# Altium schematic sheet BMC096C.schdoc (part 1 of 3)
size 432 x 279 mm; Device: C:\NSCUtils\Altium\Templates\AD18\TI_ANSI-B.SchDot; Symbol: C:\NSCUtils\Altium\Templates\AD18\TI_ANSI-B.SchDot; Width: 1700; Height: 1100; X Region Count: 6; Y Region Count: 4; Blade Width: 20; Region Start: 1; Border: 1; Title Block Position: 3; Name: C:\NSCUtils\Altium\Templates\AD18\TI_ANSI-B.SchDot; Add into BOM: yes
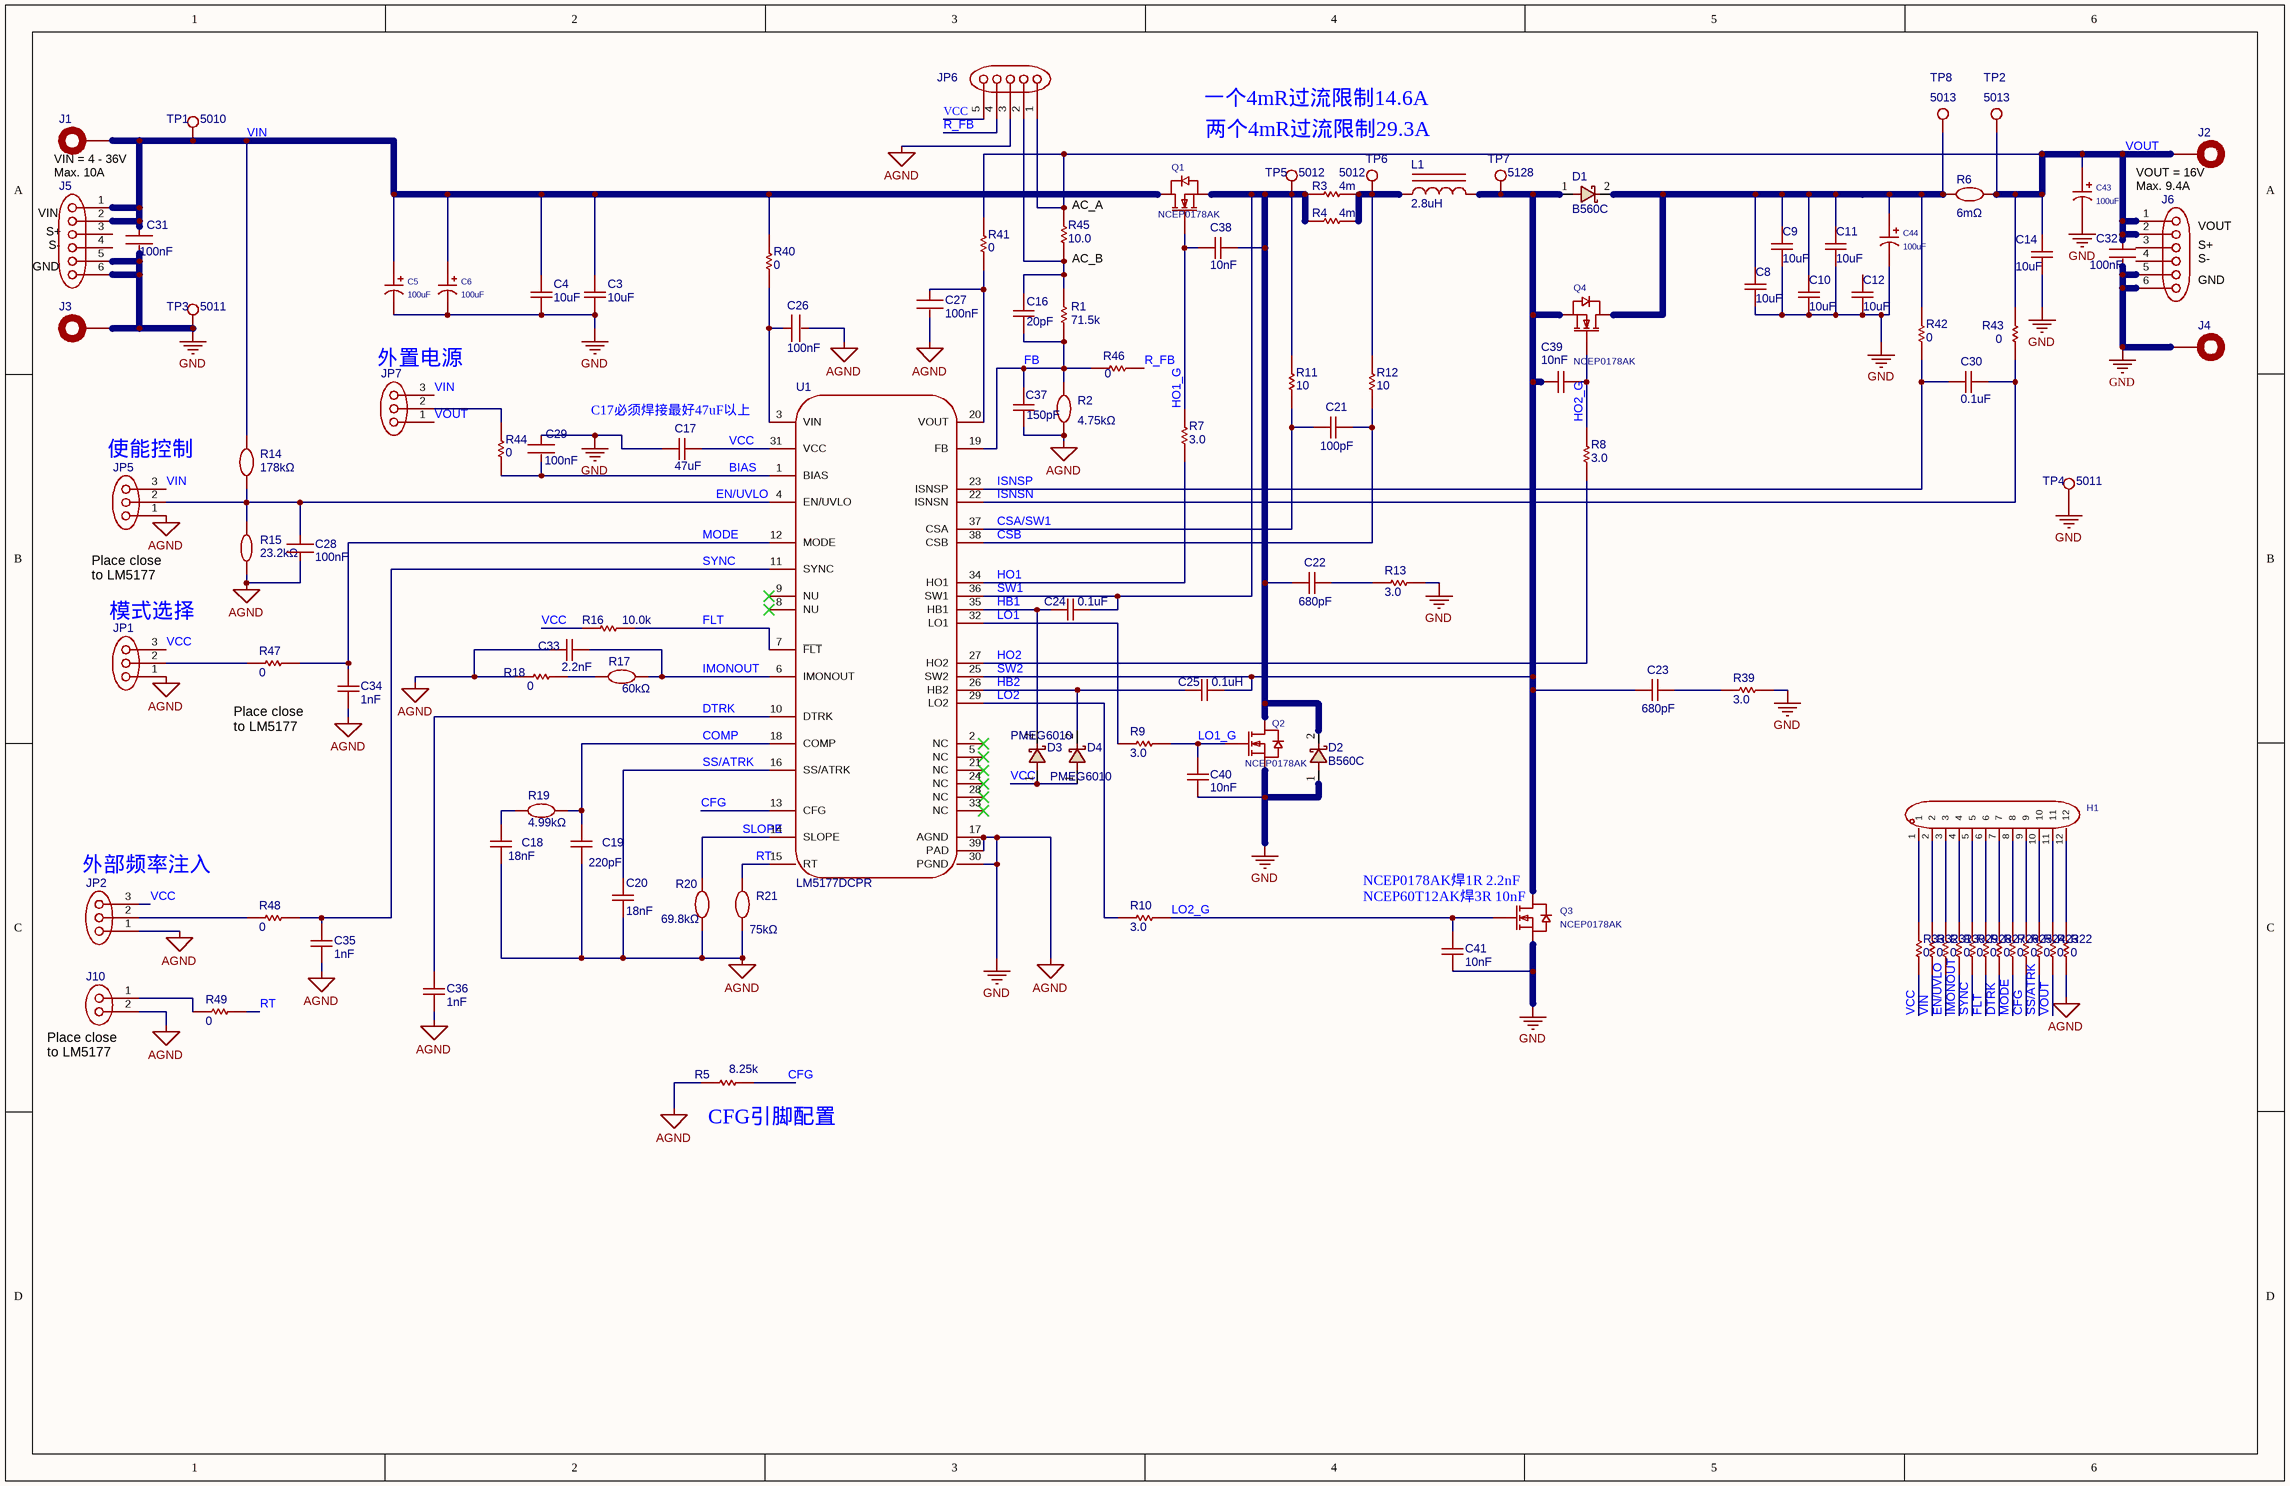
[diagram p0: BMC096C.schdoc]

## Parts
C3  ValueDisplayed: 10uF  [C1210]  (hidden comment: GCM32EC71H106KA03L)
C4  ValueDisplayed: 10uF  [C1210]  (hidden comment: GCM32EC71H106KA03L)
C5  100uF  [C_EL_D10L10]
C6  100uF  [C_EL_D10L10]
C8  ValueDisplayed: 10uF  [C1210]  (hidden comment: GCM32EC71H106KA03L)
C9  ValueDisplayed: 10uF  [C1210]  (hidden comment: GCM32EC71H106KA03L)
C10  ValueDisplayed: 10uF  [C1210]  (hidden comment: GCM32EC71H106KA03L)
C11  ValueDisplayed: 10uF  [C1210]  (hidden comment: GCM32EC71H106KA03L)
C12  ValueDisplayed: 10uF  [C1210]  (hidden comment: GCM32EC71H106KA03L)
C14  ValueDisplayed: 10uF  [C1210]  (hidden comment: GCM32EC71H106KA03L)
C16  ValueDisplayed: 20pF  [C0603S]  (hidden comment: GRM1885C2A200JA01D)
C17  ValueDisplayed: 47uF  [C0603S]  (hidden comment: GRM188R60J476ME15D)
C18  18nF  [C0603D]
C19  220pF  [C0603D]
C20  ValueDisplayed: 18nF  [C0805D]  (hidden comment: GCM21B5C1H183JA16L)
C21  ValueDisplayed: 100pF  [C0603S]  (hidden comment: GCM1885C1H101JA16J)
C22  ValueDisplayed: 680pF  [C0805D]  (hidden comment: GRM2165C1H681JA01D)
C23  ValueDisplayed: 680pF  [C0805D]  (hidden comment: GRM2165C1H681JA01D)
C24  ValueDisplayed: 0.1uF  [C0402D]  (hidden comment: 0402BB104KW500)
C25  ValueDisplayed: 0.1uH  [C0402D]  (hidden comment: 0402BB104KW500)
C26  Cap_F: 100nF  [C0603D]  (hidden comment: GCM188L81H104KA57D)
C27  Cap_F: 100nF  [C0603D]  (hidden comment: GCM188L81H104KA57D)
C28  Cap_F: 100nF  [C0603D]  (hidden comment: GCM188L81H104KA57D)
C29  Cap_F: 100nF  [C0603D]  (hidden comment: GCM188L81H104KA57D)
C30  ValueDisplayed: 0.1uF  [C0402D]  (hidden comment: 0402BB104KW500)
C31  Cap_F: 100nF  [C0603D]  (hidden comment: GCM188L81H104KA57D)
C32  Cap_F: 100nF  [C0603D]  (hidden comment: GCM188L81H104KA57D)
C33  Cap_F: 2.2nF  [C0603D]  (hidden comment: 06031C222JAT2A)
C34  Cap_F: 1nF  [C0603D]  (hidden comment: 06031C102JAT2A)
C35  Cap_F: 1nF  [C0603D]  (hidden comment: 06031C102JAT2A)
C36  Cap_F: 1nF  [C0603D]  (hidden comment: 06031C102JAT2A)
C37  ValueDisplayed: 150pF  [C0603D]  (hidden comment: GRM1885C1H151JA01D)
C38  Cap_F: 10nF  [C0603D]  (hidden comment: GRM188R72A103KA01D)
C39  Cap_F: 10nF  [C0603D]  (hidden comment: GRM188R72A103KA01D)
C40  Cap_F: 10nF  [C0603D]  (hidden comment: GRM188R72A103KA01D)
C41  Cap_F: 10nF  [C0603D]  (hidden comment: GRM188R72A103KA01D)
C43  100uF  [C_EL_D10L10]
C44  100uF  [C_EL_D10L10]
D1  B560C  [D_SMC]
D2  B560C  [D_SMC]
D3  PMEG6010  [D_SOD323]
D4  PMEG6010  [D_SOD323]
H1  (no value)  [HDR_F_1X12]
J1  108-0740-001  [BNANASKT_L_RED]  (value not drawn)
J2  108-0740-001  [BNANASKT_L_RED]  (value not drawn)
J3  108-0740-001  [BNANASKT_L_BLK]  (value not drawn)
J4  108-0740-001  [BNANASKT_L_BLK]  (value not drawn)
J5  61300611121  [HDR_F_1X6]  (value not drawn)
J6  61300611121  [HDR_F_1X6]  (value not drawn)
J10  61300211121  [HDR_F_1X2]  (value not drawn)
JP1  61300311121  [HDR_F_1X3]  (value not drawn)
JP2  61300311121  [HDR_F_1X3]  (value not drawn)
JP5  61300311121  [HDR_F_1X3]  (value not drawn)
JP6  61300511121  [HDR_F_1X5]  (value not drawn)
JP7  61300311121  [HDR_F_1X3]  (value not drawn)
L1  ValueDisplayed: 2.8uH  [L_12]  (hidden comment: APZBX1265M2R8)
Q1  NCEP0178AK  [DPAK_3]
Q2  NCEP0178AK  [DPAK_3]
Q3  NCEP0178AK  [DPAK_3]
Q4  NCEP0178AK  [DPAK_3]
R1  ValueDisplayed: 71.5k  [R0603D]  (hidden comment: RC0603FR-0771K5L)
R2  4.75kΩ  [R0603D]
R3  value 4m  [R0508]  (hidden comment: KRL2012E-M-R004-F-T5)
R4  value 4m  [R0508]  (hidden comment: KRL2012E-M-R004-F-T5)
R5  ValueDisplayed: 8.25k  [R0603D]  (hidden comment: RC0603FR-078K25L)
R6  6mΩ  [R2512]
R7  ValueDisplayed: 3.0  [R0603D]  (hidden comment: CRCW06033R00JNEA)
R8  ValueDisplayed: 3.0  [R0603D]  (hidden comment: CRCW06033R00JNEA)
R9  ValueDisplayed: 3.0  [R0603D]  (hidden comment: CRCW06033R00JNEA)
R10  ValueDisplayed: 3.0  [R0603D]  (hidden comment: CRCW06033R00JNEA)
R11  ValueDisplayed: 10  [R0603D]  (hidden comment: CRCW0603100RFKEAHP)
R12  ValueDisplayed: 10  [R0603D]  (hidden comment: CRCW0603100RFKEAHP)
R13  ValueDisplayed: 3.0  [R0603D]  (hidden comment: CRCW06033R00JNEA)
R14  178kΩ  [R0603D]
R15  23.2kΩ  [R0603D]
R16  ValueDisplayed: 10.0k  [R0603D]  (hidden comment: RT0603BRD0710KL)
R17  60kΩ  [R0603D]
R18  ValueDisplayed: 0  [R0603D]  (hidden comment: RMCF0603ZT0R00)
R19  4.99kΩ  [R0603D]
R20  69.8kΩ  [R0603D]
R21  75kΩ  [R0603D]
R22  ValueDisplayed: 0  [R0603D]  (hidden comment: RMCF0603ZT0R00)
R23  ValueDisplayed: 0  [R0603D]  (hidden comment: RMCF0603ZT0R00)
R24  ValueDisplayed: 0  [R0603D]  (hidden comment: RMCF0603ZT0R00)
R25  ValueDisplayed: 0  [R0603D]  (hidden comment: RMCF0603ZT0R00)
R26  ValueDisplayed: 0  [R0603D]  (hidden comment: RMCF0603ZT0R00)
R27  ValueDisplayed: 0  [R0603D]  (hidden comment: RMCF0603ZT0R00)
R28  ValueDisplayed: 0  [R0603D]  (hidden comment: RMCF0603ZT0R00)
R29  ValueDisplayed: 0  [R0603D]  (hidden comment: RMCF0603ZT0R00)
R30  ValueDisplayed: 0  [R0603D]  (hidden comment: RMCF0603ZT0R00)
R31  ValueDisplayed: 0  [R0603D]  (hidden comment: RMCF0603ZT0R00)
R32  ValueDisplayed: 0  [R0603D]  (hidden comment: RMCF0603ZT0R00)
R33  ValueDisplayed: 0  [R0603D]  (hidden comment: RMCF0603ZT0R00)
R39  ValueDisplayed: 3.0  [R0603D]  (hidden comment: CRCW06033R00JNEA)
R40  ValueDisplayed: 0  [R0603D]  (hidden comment: RMCF0603ZT0R00)
R41  ValueDisplayed: 0  [R0603D]  (hidden comment: RMCF0603ZT0R00)
R42  ValueDisplayed: 0  [R0603D]  (hidden comment: RMCF0603ZT0R00)
R43  ValueDisplayed: 0  [R0603D]  (hidden comment: RMCF0603ZT0R00)
R44  ValueDisplayed: 0  [R0603D]  (hidden comment: RMCF0603ZT0R00)
R45  ValueDisplayed: 10.0  [R0603D]  (hidden comment: RC0603FR-0710RL)
R46  ValueDisplayed: 0  [R0603D]  (hidden comment: RMCF0603ZT0R00)
R47  ValueDisplayed: 0  [R0603D]  (hidden comment: RMCF0603ZT0R00)
R48  ValueDisplayed: 0  [R0603D]  (hidden comment: RMCF0603ZT0R00)
R49  ValueDisplayed: 0  [R0603D]  (hidden comment: RMCF0603ZT0R00)
TP1  5010  [TPTHD_C_BLK1]
TP2  5013  [TPTHD_C_BLK1]
TP3  5011  [TPTHD_C_BLK1]
TP4  5011  [TPTHD_C_BLK1]
TP5  5012  [TPTHD_C_BLK1]
TP6  5012  [TPTHD_C_BLK1]
TP7  5128  [TPTHD_C_BLK1]
TP8  5013  [TPTHD_C_BLK1]
U1  LM5177DCPR  [SOG50_38T]

## Nets
AGND: C3.1 C4.1 C5.2 C6.2 C8.1 C9.1 C10.1 C11.1 C12.1 C14.1 C17.1 C18.1 C19.1 C20.1 C26.2 C27.2 C28.2 C29.1 C31.2 C32.2 C33.1 C34.2 C35.2 C36.2 C37.2 C40.1 C41.1 C43.2 C44.2 D2.1 J3.1 J4.1 J5.5 J5.6 J6.5 J6.6 J10.2 JP1.1 JP2.1 JP5.1 JP6.3 Q2.3(S) Q3.3(S) R2.1 R5.1 R13.1 R15.1 R18.1 R20.1 R21.1 R22.1 R39.1 TP3.1 TP4.1 U1.17(AGND) U1.30(PGND) U1.39(PAD)  [also labelled GND]
BIAS: C29.2 R44.1 U1.1(BIAS)
CFG: R5.2 R25.1 U1.13(CFG)
COMP: C19.2 R19.2 U1.18(COMP)
CSA/SW1: C21.2 R11.1 U1.37(CSA)
CSB: C21.1 R12.1 U1.38(CSB)
DTRK: C36.1 R27.1 U1.10(DTRK)
EN/UVLO: C28.1 JP5.2 R14.1 R15.2 R31.1 U1.4(EN/UVLO)
FB: C16.2 C37.1 R1.2 R2.2 R46.1 U1.19(FB)
FLT: R16.2 R28.1 U1.7(~{FLT})
HB1: C24.2 D3.2 U1.35(HB1)
HB2: C25.2 D4.2 U1.26(HB2)
HO1: R7.1 U1.34(HO1)
HO1_G: C38.1 Q1.1(G) R7.2
HO2: R8.1 U1.27(HO2)
HO2_G: C39.2 Q4.1(G) R8.2
IMONOUT: C33.2 R17.2 R30.1 U1.6(IMONOUT)
ISNSN: C30.1 R43.1 U1.22(ISNSN)
ISNSP: C30.2 R42.1 U1.23(ISNSP)
LO1: R9.2 U1.32(LO1)
LO1_G: C40.2 Q2.1(G) R9.1
LO2: R10.2 U1.29(LO2)
LO2_G: C41.2 Q3.1(G) R10.1
MODE: C34.1 R26.1 R47.2 U1.12(MODE)
R_FB: JP6.4 R46.2
RT: R21.2 R49.1 U1.15(RT)
SLOPE: R20.2 U1.14(SLOPE)
SS/ATRK: C20.2 R24.1 U1.16(SS/ATRK)
SW1: C22.2 C24.1 C38.2 D2.2 Q1.3(S) Q2.4(D) R3.1 R4.1 R11.2 TP5.1 U1.36(SW1)
SW2: C23.2 C25.1 C39.1 D1.1 L1.2 Q3.4(D) Q4.3(S) TP7.1 U1.25(SW2)
SYNC: C35.1 R29.1 R48.2 U1.11(SYNC)
VCC: C17.2 D3.1 D4.1 JP1.3 JP2.3 JP6.5 R16.1 R33.1 U1.31(VCC)
VIN: C3.2 C4.2 C5.1 C6.1 C31.1 J1.1 J5.1 J5.2 JP5.3 JP7.3 Q1.4(D) R14.2 R32.1 R40.2 TP1.1
VOUT: C14.2 C32.1 C43.1 J2.1 J6.1 J6.2 JP6.1 JP7.1 R6.2 R23.1 R41.2 R43.2 R45.2 TP2.1
NetC8_2: C8.2 C9.2 C10.2 C11.2 C44.1 D1.2 Q4.4(D) R6.1 R42.2 TP8.1
NetC16_1: C16.1 JP6.2 R1.1 R45.1
NetC18_2: C18.2 R19.1
NetC22_1: C22.1 R13.2
NetC23_1: C23.1 R39.2
NetC26_1: C26.1 R40.1 U1.3(VIN)
NetC27_1: C27.1 R41.1 U1.20(VOUT)
NetH1_1: H1.1 R33.2
NetH1_2: H1.2 R32.2
NetH1_3: H1.3 R31.2
NetH1_4: H1.4 R30.2
NetH1_5: H1.5 R29.2
NetH1_6: H1.6 R28.2
NetH1_7: H1.7 R27.2
NetH1_8: H1.8 R26.2
NetH1_9: H1.9 R25.2
NetH1_10: H1.10 R24.2
NetH1_11: H1.11 R23.2
NetH1_12: H1.12 R22.2
NetJ10_1: J10.1 R49.2
NetJP1_2: JP1.2 R47.1
NetJP2_2: JP2.2 R48.1
NetJP7_2: JP7.2 R44.2
NetL1_1: L1.1 R3.2 R4.2 R12.2 TP6.1
NetR17_1: R17.1 R18.2

Not connected (* = marked no-connect by the designer): C12 2; J5 3 4; J6 3 4; U1 2(NC)* 5(NC)* 8(NU)* 9(NU)* 21(NC)* 24(NC)* 28(NC)* 33(NC)*

## Notes on the sheet
- (near J1) VIN = 4 - 36V
- 一个4mR过流限制14.6A
- 两个4mR过流限制29.3A
- (near J5) VIN
- (near J5) S+
- Max. 10A
- (near R45) AC_A
- (near J2) VOUT = 16V
- Max. 9.4A
- (near J6) VOUT
- (near J5) GND
- (near J5) S-
- (near R45) AC_B
- (near J6) S+
- (near J6) S-
- (near J6) GND
- (near JP7) 外置电源
- (near C17) C17必须焊接最好47uF以上
- (near JP5) 使能控制
- (near JP5) Place close
  to LM5177
- (near JP1) 模式选择
- Place close
  to LM5177
- (near JP2) 外部频率注入
- (near Q3) NCEP0178AK焊1R 2.2nF
- (near Q3) NCEP60T12AK焊3R 10nF
- (near J10) Place close
  to LM5177
- (near R5) CFG引脚配置